# Altium schematic sheet Triac Drive.SchDoc
size A; SheetNumber: 3; SheetTotal: 3
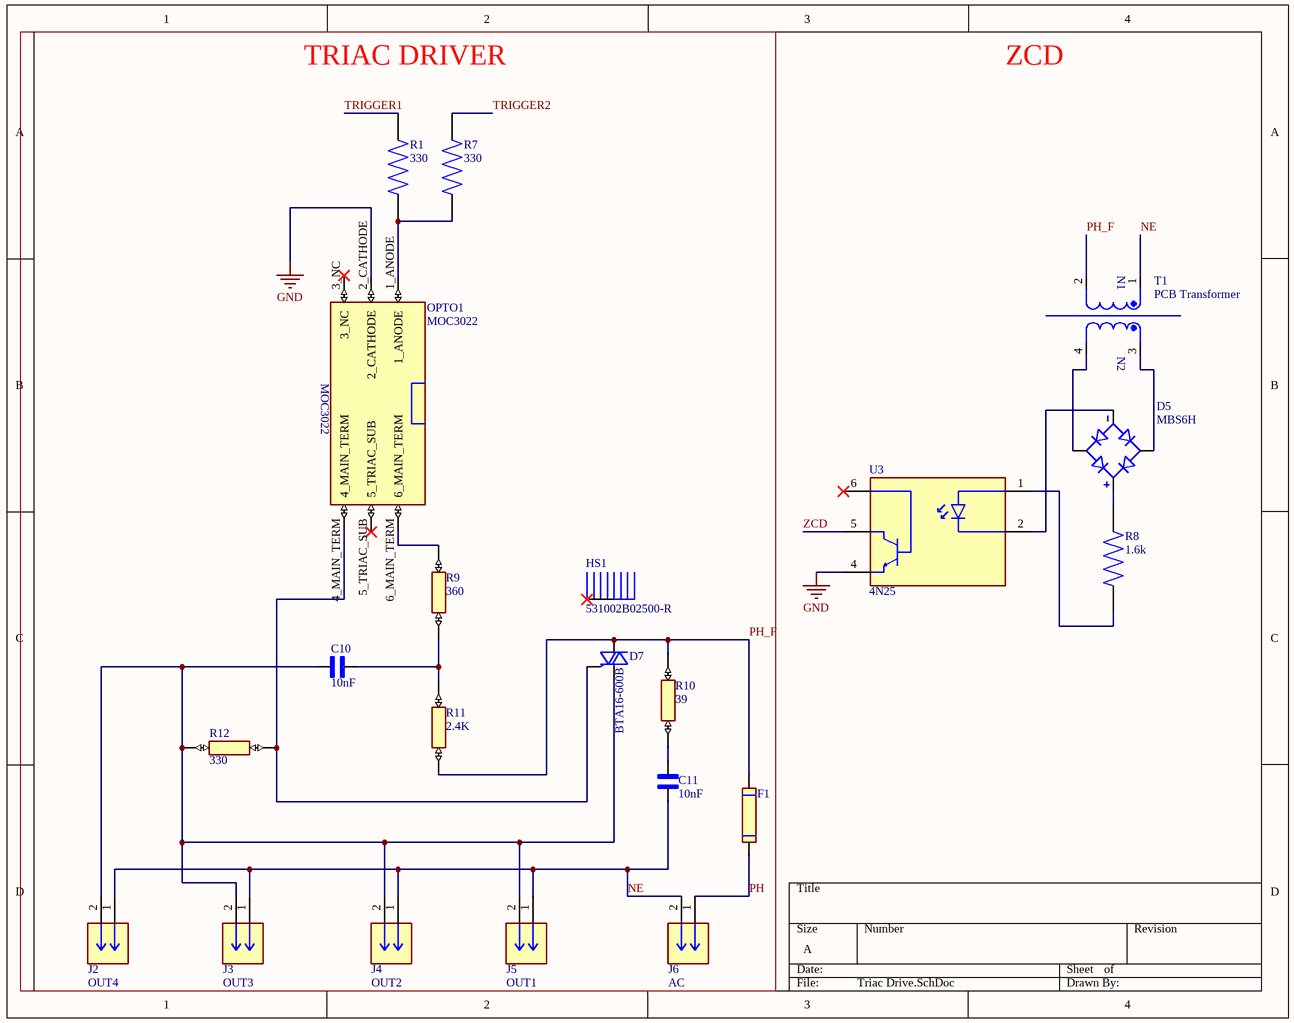
[diagram p0: Triac Drive.SchDoc]

## Parts
C10  10nF  [PCBComponent_1]
C11  10nF  [PCBComponent_1]
D5  MBS6H  [DIOB_MBS6H]
D7  BTA16-600B  [TO255P1040X460X1975-3]
F1  696101000002  [696101000002]  (value not drawn)
HS1  531002B02500-R  [HSINK_531002B02500-R]
J2  OUT4  [CONN_398800302_MOL]
J3  OUT3  [CONN_398800302_MOL]
J4  OUT2  [CONN_398800302_MOL]
J5  OUT1  [CONN_398800302_MOL]
J6  AC  [CONN_398800302_MOL]
OPTO1  MOC3022  [MOC3022]
R1  330  [RESAD700W45L350D185]
R7  330  [RESAD700W45L350D185]
R8  1.6k  [RESAD700W45L350D185]
R9  360  [RESAD2600W80L1000D400]
R10  39  [RESAD3850W80L1650D550]
R11  2.4K  [RESAD2600W80L1000D400]
R12  330  [RESAD2600W80L1000D400]
T1  PCB Transformer  [PCBComponent_1]
U3  4N25  [DIP762W50P254L712H400Q6N]

## Blocks framed on the sheet
TRIAC DRIVER: C10 C11 D7 F1 HS1 J2-J6 OPTO1 R1 R7 R9-R12

## Nets
GND: OPTO1.2_CATHODE U3.4(E)
NE: C11.2 J2.1 J3.1 J4.1 J5.1 J6.2 T1.1
PH: F1.1 J6.1
PH_F: D7.2(A2) F1.2 R10.2 R11.1 T1.2
TRIGGER1: R1.2
TRIGGER2: R7.2
ZCD: U3.5(C)
NetC10_1: C10.1 R9.1 R11.2
NetC10_2: C10.2 D7.1(A1) J2.2 J3.2 J4.2 J5.2 R12.2
NetC11_1: C11.1 R10.1
NetD5_AC1: D5.AC1 T1.4
NetD5_AC2: D5.AC2 T1.3
NetD5_NEG: D5.NEG U3.2(K)
NetD5_POS: D5.POS R8.2
NetD7_3: D7.3(G) OPTO1.4_MAIN_TERM R12.1
NetHS1_1: HS1.1(S) HS1.2(S)
NetOPTO1_1_ANODE: OPTO1.1_ANODE R1.1 R7.1
NetOPTO1_6_MAIN_TERM: OPTO1.6_MAIN_TERM R9.2
NetR8_1: R8.1 U3.1(A)

Not connected (* = marked no-connect by the designer): OPTO1 3_NC* 5_TRIAC_SUB*; U3 6(B)*

## Notes on the sheet
- ZCD
- (in symbol EI-30) N1; N2

## Library data of the parts
C10 C11 = Capacitor 10nF 630v
D5 = MBS6H: MF: {'manufacturer': u'Taiwan Semiconductor Corporation'}; Package: None; Price: None; Value: *; MP: MBS6H; Availability: Unavailable
D7 = BTA16-600B: TRIAC Alternistor - Snubberless 600 V 16 A Through Hole TO-220; MF: STMicroelectronics; SnapEDA_Link: https://www.snapeda.com/parts/BTA16-600B/STMicroelectronics/view-part/?ref=snap; Package: TO-220-3 STMicroelectronics; Value: *; MP: BTA16-600B; Check_prices: https://www.snapeda.com/parts/BTA16-600B/STMicroelectronics/view-part/?ref=eda
F1 = 696101000002: MF: {'manufacturer': u'W\xfcrth Elektronik'}; Package: None; Price: None; Value: *; MP: 696101000002; Availability: Unavailable
HS1 = 531002B02500-R: Heatsink To-220 2 Holes 2 Pins 1.38 X0.50 X1.00; MF: Jameco Valuepro; SnapEDA_Link: https://www.snapeda.com/parts/531002B02500-R/Jameco+Benchpro/view-part/?ref=snap; Package: Heatsink Jameco Valuepro; Value: *; MP: 531002B02500-R; Check_prices: https://www.snapeda.com/parts/531002B02500-R/Jameco+Benchpro/view-part/?ref=eda
J2-J6 = 398800302: 2 Position Wire to Board Terminal Block Horizontal with Board 0.200 (5.08mm) Through Hole; MF: Molex; MP: 0398800302; SnapEDA_Link: https://www.snapeda.com/parts/0398800302/Molex/view-part/?ref=snap; Package: None; Value: *; Check_prices: https://www.snapeda.com/parts/0398800302/Molex/view-part/?ref=eda
OPTO1 = MOC3022: Optoisolator Triac Output 5000Vrms 1 Channel 6-DIP; MF: Isocom Components; SnapEDA_Link: https://www.snapeda.com/parts/MOC3022/Isocom/view-part/?ref=snap; Package: DIP-6 Isocom Components; Value: *; MP: MOC3022; Check_prices: https://www.snapeda.com/parts/MOC3022/Isocom/view-part/?ref=eda
R1 R7 R8 = 2-1623927-3: Carbon Film Resistors - Through Hole 1K Ohm 5% 1/4W Res Carbon Film; Power_Rating: .25 W; MF: TE Connectivity; Voltage_Rating: 200 V; SnapEDA_Link: https://www.snapeda.com/parts/2-1623927-3/TE+Connectivity/view-part/?ref=snap; Package: None; Resistance: 1K; Value: *; MP: 2-1623927-3; EU_RoHS_Compliance: Compliant; Tolerance: 5%; Check_prices: https://www.snapeda.com/parts/2-1623927-3/TE+Connectivity/view-part/?ref=eda
R9 R12 = EMC2-47RKI: RES 360 OHM 2W 10% AXIAL; MF: TT Electronics/Welwyn; SnapEDA_Link: https://www.snapeda.com/parts/EMC2-47RKI/TT+Electronics%252FWelwyn/view-part/?ref=snap; Package: None; Value: *; MP: EMC2-47RKI; Check_prices: https://www.snapeda.com/parts/EMC2-47RKI/TT+Electronics%252FWelwyn/view-part/?ref=eda
R10 = PCF1C3R3K: 3.3 Ohms Â±10% 1W Through Hole Resistor Axial Automotive AEC-Q200, Flame Proof, Safety, Non-Inductive, Pulse Withstanding Ceramic; MF: KOA Speer; SnapEDA_Link: https://www.snapeda.com/parts/PCF1C3R3K/KOA+Speer/view-part/?ref=snap; Package: None; Value: *; MP: PCF1C3R3K; Check_prices: https://www.snapeda.com/parts/PCF1C3R3K/KOA+Speer/view-part/?ref=eda
R11 = EMC2-47RKI: RES 2.4K OHM 2W 10% AXIAL; MF: TT Electronics/Welwyn; SnapEDA_Link: https://www.snapeda.com/parts/EMC2-47RKI/TT+Electronics%252FWelwyn/view-part/?ref=snap; Package: None; Value: *; MP: EMC2-47RKI; Check_prices: https://www.snapeda.com/parts/EMC2-47RKI/TT+Electronics%252FWelwyn/view-part/?ref=eda
T1 = EI-30
U3 = 4N25: Optoisolator, Analog, 6-Pin DIP, Transistor, w/Base Connection | Vishay / Small Signal & Opto Products (SSP) 4N25; MF: Vishay Semiconductor; SnapEDA_Link: https://www.snapeda.com/parts/4N25/Vishay/view-part/?ref=snap; Package: DIP-6 Everlight Electronics CO., LTD; Value: *; MP: 4N25; Check_prices: https://www.snapeda.com/parts/4N25/Vishay/view-part/?ref=eda